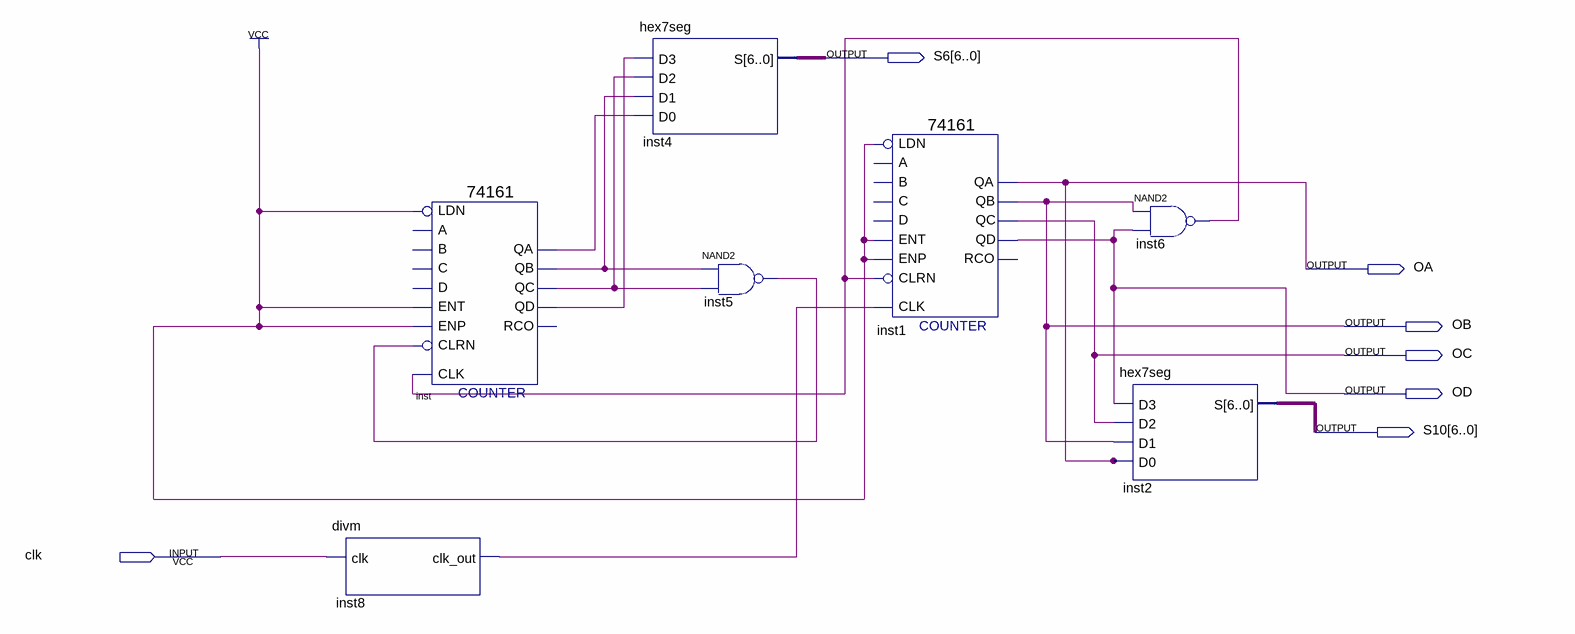
[diagram p0: schematic sheet]
// Quartus schematic exp4.bdf as structural Verilog: 7 symbols, 7 pins
module exp4 (
  input  clk,
  output [6:0] S6,
  output OA,
  output OB,
  output OC,
  output OD,
  output [6:0] S10
);

  wire inst5_out, inst6_out, inst8_clk_out, inst_qa, inst_qb, inst_qc, inst_qd;

  divm inst8 (.clk(clk), .clk_out(inst8_clk_out));
  \74161  inst (
    .CLRN(inst5_out), .CLK(inst6_out), .ENP(1'b1), .LDN(1'b1), .ENT(1'b1), .QD(inst_qd), .QC(inst_qc),
    .QB(inst_qb), .QA(inst_qa));  // open: A, D, B, C, RCO
  hex7seg inst4 (.D3(inst_qd), .D2(inst_qc), .D1(inst_qb), .D0(inst_qa), .S(S6));
  nand inst5 (inst5_out, inst_qb, inst_qc);
  \74161  inst1 (
    .CLRN(inst6_out), .CLK(inst8_clk_out), .ENP(1'b1), .LDN(1'b1), .ENT(1'b1), .QD(OD), .QC(OC), .QB(OB),
    .QA(OA));  // open: A, D, B, C, RCO
  nand inst6 (inst6_out, OB, OD);
  hex7seg inst2 (.D3(OD), .D2(OC), .D1(OB), .D0(OA), .S(S10));
endmodule
